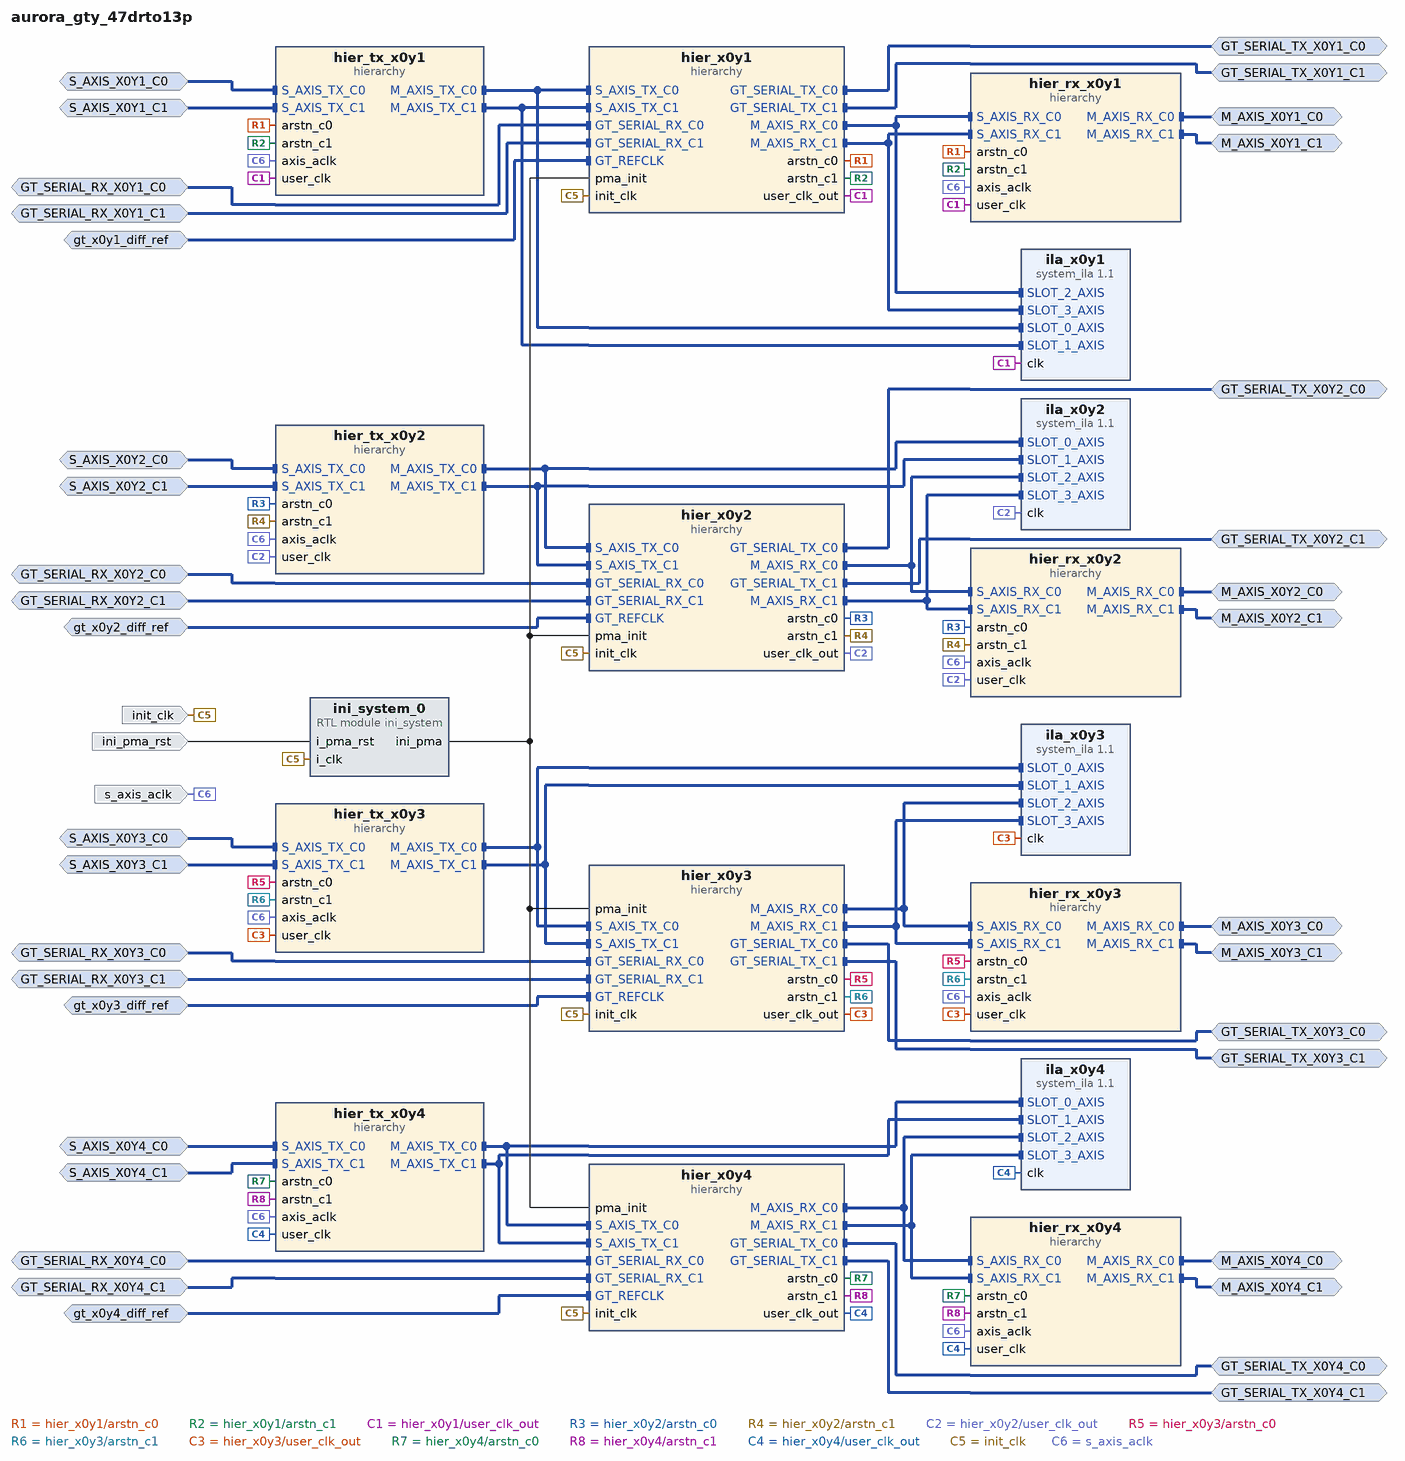
[diagram p0: block diagram of the top level]
# Vivado block design aurora_gty_47drto13p, xczu47dr-ffvg1517-2-i, Vivado 2025.2
create_bd_design aurora_gty_47drto13p

create_bd_intf_port -mode Slave -vlnv xilinx.com:interface:diff_clock_rtl:1.0 gt_x0y1_diff_ref
set_property -dict {CONFIG.FREQ_HZ 156250000} [get_bd_intf_ports gt_x0y1_diff_ref]
create_bd_intf_port -mode Slave -vlnv xilinx.com:interface:diff_clock_rtl:1.0 gt_x0y2_diff_ref
set_property -dict {CONFIG.FREQ_HZ 156250000} [get_bd_intf_ports gt_x0y2_diff_ref]
create_bd_intf_port -mode Slave -vlnv xilinx.com:display_aurora64b66b:GT_Serial_Transceiver_Pins_RX_rtl:1.0 GT_SERIAL_RX_X0Y1_C0
create_bd_intf_port -mode Slave -vlnv xilinx.com:display_aurora64b66b:GT_Serial_Transceiver_Pins_RX_rtl:1.0 GT_SERIAL_RX_X0Y1_C1
create_bd_intf_port -mode Master -vlnv xilinx.com:display_aurora64b66b:GT_Serial_Transceiver_Pins_TX_rtl:1.0 GT_SERIAL_TX_X0Y1_C1
create_bd_intf_port -mode Master -vlnv xilinx.com:display_aurora64b66b:GT_Serial_Transceiver_Pins_TX_rtl:1.0 GT_SERIAL_TX_X0Y2_C1
create_bd_intf_port -mode Slave -vlnv xilinx.com:display_aurora64b66b:GT_Serial_Transceiver_Pins_RX_rtl:1.0 GT_SERIAL_RX_X0Y2_C0
create_bd_intf_port -mode Slave -vlnv xilinx.com:display_aurora64b66b:GT_Serial_Transceiver_Pins_RX_rtl:1.0 GT_SERIAL_RX_X0Y2_C1
create_bd_intf_port -mode Master -vlnv xilinx.com:display_aurora64b66b:GT_Serial_Transceiver_Pins_TX_rtl:1.0 GT_SERIAL_TX_X0Y2_C0
create_bd_intf_port -mode Master -vlnv xilinx.com:display_aurora64b66b:GT_Serial_Transceiver_Pins_TX_rtl:1.0 GT_SERIAL_TX_X0Y1_C0
create_bd_intf_port -mode Master -vlnv xilinx.com:interface:axis_rtl:1.0 M_AXIS_X0Y2_C0
set_property -dict {CONFIG.FREQ_HZ 256000000} [get_bd_intf_ports M_AXIS_X0Y2_C0]
create_bd_intf_port -mode Master -vlnv xilinx.com:interface:axis_rtl:1.0 M_AXIS_X0Y2_C1
set_property -dict {CONFIG.FREQ_HZ 256000000} [get_bd_intf_ports M_AXIS_X0Y2_C1]
create_bd_intf_port -mode Master -vlnv xilinx.com:interface:axis_rtl:1.0 M_AXIS_X0Y1_C0
set_property -dict {CONFIG.FREQ_HZ 256000000} [get_bd_intf_ports M_AXIS_X0Y1_C0]
create_bd_intf_port -mode Master -vlnv xilinx.com:interface:axis_rtl:1.0 M_AXIS_X0Y1_C1
set_property -dict {CONFIG.FREQ_HZ 256000000} [get_bd_intf_ports M_AXIS_X0Y1_C1]
create_bd_intf_port -mode Slave -vlnv xilinx.com:interface:axis_rtl:1.0 S_AXIS_X0Y2_C1
set_property -dict [list \
  CONFIG.FREQ_HZ 256000000 \
  CONFIG.HAS_TKEEP 0 \
  CONFIG.HAS_TLAST 1 \
  CONFIG.HAS_TREADY 1 \
  CONFIG.HAS_TSTRB 0 \
  CONFIG.LAYERED_METADATA undef \
  CONFIG.TDATA_NUM_BYTES 20 \
  CONFIG.TDEST_WIDTH 0 \
  CONFIG.TID_WIDTH 0 \
  CONFIG.TUSER_WIDTH 64 \
] [get_bd_intf_ports S_AXIS_X0Y2_C1]
create_bd_intf_port -mode Slave -vlnv xilinx.com:interface:axis_rtl:1.0 S_AXIS_X0Y2_C0
set_property -dict [list \
  CONFIG.FREQ_HZ 256000000 \
  CONFIG.HAS_TKEEP 0 \
  CONFIG.HAS_TLAST 1 \
  CONFIG.HAS_TREADY 1 \
  CONFIG.HAS_TSTRB 0 \
  CONFIG.LAYERED_METADATA undef \
  CONFIG.TDATA_NUM_BYTES 20 \
  CONFIG.TDEST_WIDTH 0 \
  CONFIG.TID_WIDTH 0 \
  CONFIG.TUSER_WIDTH 64 \
] [get_bd_intf_ports S_AXIS_X0Y2_C0]
create_bd_intf_port -mode Slave -vlnv xilinx.com:interface:axis_rtl:1.0 S_AXIS_X0Y1_C1
set_property -dict [list \
  CONFIG.FREQ_HZ 256000000 \
  CONFIG.HAS_TKEEP 0 \
  CONFIG.HAS_TLAST 1 \
  CONFIG.HAS_TREADY 1 \
  CONFIG.HAS_TSTRB 0 \
  CONFIG.LAYERED_METADATA undef \
  CONFIG.TDATA_NUM_BYTES 20 \
  CONFIG.TDEST_WIDTH 0 \
  CONFIG.TID_WIDTH 0 \
  CONFIG.TUSER_WIDTH 64 \
] [get_bd_intf_ports S_AXIS_X0Y1_C1]
create_bd_intf_port -mode Slave -vlnv xilinx.com:interface:axis_rtl:1.0 S_AXIS_X0Y1_C0
set_property -dict [list \
  CONFIG.FREQ_HZ 256000000 \
  CONFIG.HAS_TKEEP 0 \
  CONFIG.HAS_TLAST 1 \
  CONFIG.HAS_TREADY 1 \
  CONFIG.HAS_TSTRB 0 \
  CONFIG.LAYERED_METADATA undef \
  CONFIG.TDATA_NUM_BYTES 20 \
  CONFIG.TDEST_WIDTH 0 \
  CONFIG.TID_WIDTH 0 \
  CONFIG.TUSER_WIDTH 64 \
] [get_bd_intf_ports S_AXIS_X0Y1_C0]
create_bd_intf_port -mode Slave -vlnv xilinx.com:interface:diff_clock_rtl:1.0 gt_x0y3_diff_ref
set_property -dict {CONFIG.FREQ_HZ 156250000} [get_bd_intf_ports gt_x0y3_diff_ref]
create_bd_intf_port -mode Slave -vlnv xilinx.com:display_aurora64b66b:GT_Serial_Transceiver_Pins_RX_rtl:1.0 GT_SERIAL_RX_X0Y3_C0
create_bd_intf_port -mode Slave -vlnv xilinx.com:display_aurora64b66b:GT_Serial_Transceiver_Pins_RX_rtl:1.0 GT_SERIAL_RX_X0Y3_C1
create_bd_intf_port -mode Master -vlnv xilinx.com:display_aurora64b66b:GT_Serial_Transceiver_Pins_TX_rtl:1.0 GT_SERIAL_TX_X0Y3_C1
create_bd_intf_port -mode Master -vlnv xilinx.com:display_aurora64b66b:GT_Serial_Transceiver_Pins_TX_rtl:1.0 GT_SERIAL_TX_X0Y3_C0
create_bd_intf_port -mode Master -vlnv xilinx.com:interface:axis_rtl:1.0 M_AXIS_X0Y3_C0
set_property -dict {CONFIG.FREQ_HZ 256000000} [get_bd_intf_ports M_AXIS_X0Y3_C0]
create_bd_intf_port -mode Master -vlnv xilinx.com:interface:axis_rtl:1.0 M_AXIS_X0Y3_C1
set_property -dict {CONFIG.FREQ_HZ 256000000} [get_bd_intf_ports M_AXIS_X0Y3_C1]
create_bd_intf_port -mode Slave -vlnv xilinx.com:interface:diff_clock_rtl:1.0 gt_x0y4_diff_ref
set_property -dict {CONFIG.FREQ_HZ 156250000} [get_bd_intf_ports gt_x0y4_diff_ref]
create_bd_intf_port -mode Slave -vlnv xilinx.com:display_aurora64b66b:GT_Serial_Transceiver_Pins_RX_rtl:1.0 GT_SERIAL_RX_X0Y4_C0
create_bd_intf_port -mode Slave -vlnv xilinx.com:display_aurora64b66b:GT_Serial_Transceiver_Pins_RX_rtl:1.0 GT_SERIAL_RX_X0Y4_C1
create_bd_intf_port -mode Master -vlnv xilinx.com:display_aurora64b66b:GT_Serial_Transceiver_Pins_TX_rtl:1.0 GT_SERIAL_TX_X0Y4_C1
create_bd_intf_port -mode Master -vlnv xilinx.com:display_aurora64b66b:GT_Serial_Transceiver_Pins_TX_rtl:1.0 GT_SERIAL_TX_X0Y4_C0
create_bd_intf_port -mode Master -vlnv xilinx.com:interface:axis_rtl:1.0 M_AXIS_X0Y4_C0
set_property -dict {CONFIG.FREQ_HZ 256000000} [get_bd_intf_ports M_AXIS_X0Y4_C0]
create_bd_intf_port -mode Master -vlnv xilinx.com:interface:axis_rtl:1.0 M_AXIS_X0Y4_C1
set_property -dict {CONFIG.FREQ_HZ 256000000} [get_bd_intf_ports M_AXIS_X0Y4_C1]
create_bd_intf_port -mode Slave -vlnv xilinx.com:interface:axis_rtl:1.0 S_AXIS_X0Y3_C1
set_property -dict [list \
  CONFIG.FREQ_HZ 256000000 \
  CONFIG.HAS_TKEEP 0 \
  CONFIG.HAS_TLAST 1 \
  CONFIG.HAS_TREADY 1 \
  CONFIG.HAS_TSTRB 0 \
  CONFIG.LAYERED_METADATA undef \
  CONFIG.TDATA_NUM_BYTES 20 \
  CONFIG.TDEST_WIDTH 0 \
  CONFIG.TID_WIDTH 0 \
  CONFIG.TUSER_WIDTH 64 \
] [get_bd_intf_ports S_AXIS_X0Y3_C1]
create_bd_intf_port -mode Slave -vlnv xilinx.com:interface:axis_rtl:1.0 S_AXIS_X0Y3_C0
set_property -dict [list \
  CONFIG.FREQ_HZ 256000000 \
  CONFIG.HAS_TKEEP 0 \
  CONFIG.HAS_TLAST 1 \
  CONFIG.HAS_TREADY 1 \
  CONFIG.HAS_TSTRB 0 \
  CONFIG.LAYERED_METADATA undef \
  CONFIG.TDATA_NUM_BYTES 20 \
  CONFIG.TDEST_WIDTH 0 \
  CONFIG.TID_WIDTH 0 \
  CONFIG.TUSER_WIDTH 64 \
] [get_bd_intf_ports S_AXIS_X0Y3_C0]
create_bd_intf_port -mode Slave -vlnv xilinx.com:interface:axis_rtl:1.0 S_AXIS_X0Y4_C1
set_property -dict [list \
  CONFIG.FREQ_HZ 256000000 \
  CONFIG.HAS_TKEEP 0 \
  CONFIG.HAS_TLAST 1 \
  CONFIG.HAS_TREADY 1 \
  CONFIG.HAS_TSTRB 0 \
  CONFIG.LAYERED_METADATA undef \
  CONFIG.TDATA_NUM_BYTES 20 \
  CONFIG.TDEST_WIDTH 0 \
  CONFIG.TID_WIDTH 0 \
  CONFIG.TUSER_WIDTH 64 \
] [get_bd_intf_ports S_AXIS_X0Y4_C1]
create_bd_intf_port -mode Slave -vlnv xilinx.com:interface:axis_rtl:1.0 S_AXIS_X0Y4_C0
set_property -dict [list \
  CONFIG.FREQ_HZ 256000000 \
  CONFIG.HAS_TKEEP 0 \
  CONFIG.HAS_TLAST 1 \
  CONFIG.HAS_TREADY 1 \
  CONFIG.HAS_TSTRB 0 \
  CONFIG.LAYERED_METADATA undef \
  CONFIG.TDATA_NUM_BYTES 20 \
  CONFIG.TDEST_WIDTH 0 \
  CONFIG.TID_WIDTH 0 \
  CONFIG.TUSER_WIDTH 64 \
] [get_bd_intf_ports S_AXIS_X0Y4_C0]
create_bd_port -dir I -type clk init_clk
create_bd_port -dir I -type rst ini_pma_rst
set_property -dict {CONFIG.POLARITY ACTIVE_HIGH} [get_bd_ports ini_pma_rst]
create_bd_port -dir I -type clk s_axis_aclk
set_property -dict [list \
  CONFIG.ASSOCIATED_BUSIF M_AXIS_X0Y2_C0:M_AXIS_X0Y2_C0_1:M_AXIS_X0Y1_C0:M_AXIS_X0Y1_C0_1:S_AXIS_X0Y2_C1:S_AXIS_X0Y2_C1_1:S_AXIS_X0Y1_C1:S_AXIS_X0Y1_C1_1:M_AXIS_X0Y3_C0:M_AXIS_X0Y3_C0_1:M_AXIS_X0Y4_C0:M_AXIS_X0Y4_C0_1:S_AXIS_X0Y3_C1:S_AXIS_X0Y3_C1_1:S_AXIS_X0Y4_C1:S_AXIS_X0Y4_C1_1:M_AXIS_X0Y2_C1:M_AXIS_X0Y1_C1:S_AXIS_X0Y2_C0:S_AXIS_X0Y1_C0:M_AXIS_X0Y3_C1:M_AXIS_X0Y4_C1:S_AXIS_X0Y3_C0:S_AXIS_X0Y4_C0 \
  CONFIG.FREQ_HZ 256000000 \
] [get_bd_ports s_axis_aclk]

create_bd_cell -type hier hier_x0y1
create_bd_cell -type hier hier_tx_x0y1
create_bd_cell -type hier hier_tx_x0y2
create_bd_cell -type hier hier_rx_x0y1
create_bd_cell -type module -reference ini_system ini_system_0
create_bd_cell -type hier hier_x0y2
create_bd_cell -type hier hier_rx_x0y2
create_bd_cell -type hier hier_x0y3
create_bd_cell -type hier hier_rx_x0y3
create_bd_cell -type hier hier_x0y4
create_bd_cell -type hier hier_rx_x0y4
create_bd_cell -type hier hier_tx_x0y3
create_bd_cell -type hier hier_tx_x0y4
create_bd_cell -type ip -vlnv xilinx.com:ip:system_ila:1.1 ila_x0y1
set_property -dict [list \
  CONFIG.C_DATA_DEPTH 2048 \
  CONFIG.C_MON_TYPE INTERFACE \
  CONFIG.C_NUM_MONITOR_SLOTS 4 \
  CONFIG.C_SLOT_0_INTF_TYPE xilinx.com:interface:axis_rtl:1.0 \
  CONFIG.C_SLOT_1_INTF_TYPE xilinx.com:interface:axis_rtl:1.0 \
  CONFIG.C_SLOT_2_INTF_TYPE xilinx.com:interface:axis_rtl:1.0 \
  CONFIG.C_SLOT_3_INTF_TYPE xilinx.com:interface:axis_rtl:1.0 \
] [get_bd_cells ila_x0y1]
create_bd_cell -type ip -vlnv xilinx.com:ip:system_ila:1.1 ila_x0y2
set_property -dict [list \
  CONFIG.C_DATA_DEPTH 2048 \
  CONFIG.C_MON_TYPE INTERFACE \
  CONFIG.C_NUM_MONITOR_SLOTS 4 \
  CONFIG.C_SLOT_0_INTF_TYPE xilinx.com:interface:axis_rtl:1.0 \
  CONFIG.C_SLOT_1_INTF_TYPE xilinx.com:interface:axis_rtl:1.0 \
  CONFIG.C_SLOT_2_INTF_TYPE xilinx.com:interface:axis_rtl:1.0 \
  CONFIG.C_SLOT_3_INTF_TYPE xilinx.com:interface:axis_rtl:1.0 \
] [get_bd_cells ila_x0y2]
create_bd_cell -type ip -vlnv xilinx.com:ip:system_ila:1.1 ila_x0y3
set_property -dict [list \
  CONFIG.C_DATA_DEPTH 2048 \
  CONFIG.C_MON_TYPE INTERFACE \
  CONFIG.C_NUM_MONITOR_SLOTS 4 \
  CONFIG.C_SLOT_0_INTF_TYPE xilinx.com:interface:axis_rtl:1.0 \
  CONFIG.C_SLOT_1_INTF_TYPE xilinx.com:interface:axis_rtl:1.0 \
  CONFIG.C_SLOT_2_INTF_TYPE xilinx.com:interface:axis_rtl:1.0 \
  CONFIG.C_SLOT_3_INTF_TYPE xilinx.com:interface:axis_rtl:1.0 \
] [get_bd_cells ila_x0y3]
create_bd_cell -type ip -vlnv xilinx.com:ip:system_ila:1.1 ila_x0y4
set_property -dict [list \
  CONFIG.C_DATA_DEPTH 2048 \
  CONFIG.C_MON_TYPE INTERFACE \
  CONFIG.C_NUM_MONITOR_SLOTS 4 \
  CONFIG.C_SLOT_0_INTF_TYPE xilinx.com:interface:axis_rtl:1.0 \
  CONFIG.C_SLOT_1_INTF_TYPE xilinx.com:interface:axis_rtl:1.0 \
  CONFIG.C_SLOT_2_INTF_TYPE xilinx.com:interface:axis_rtl:1.0 \
  CONFIG.C_SLOT_3_INTF_TYPE xilinx.com:interface:axis_rtl:1.0 \
] [get_bd_cells ila_x0y4]

# ---- hierarchy /hier_x0y1 ----
current_bd_instance /hier_x0y1
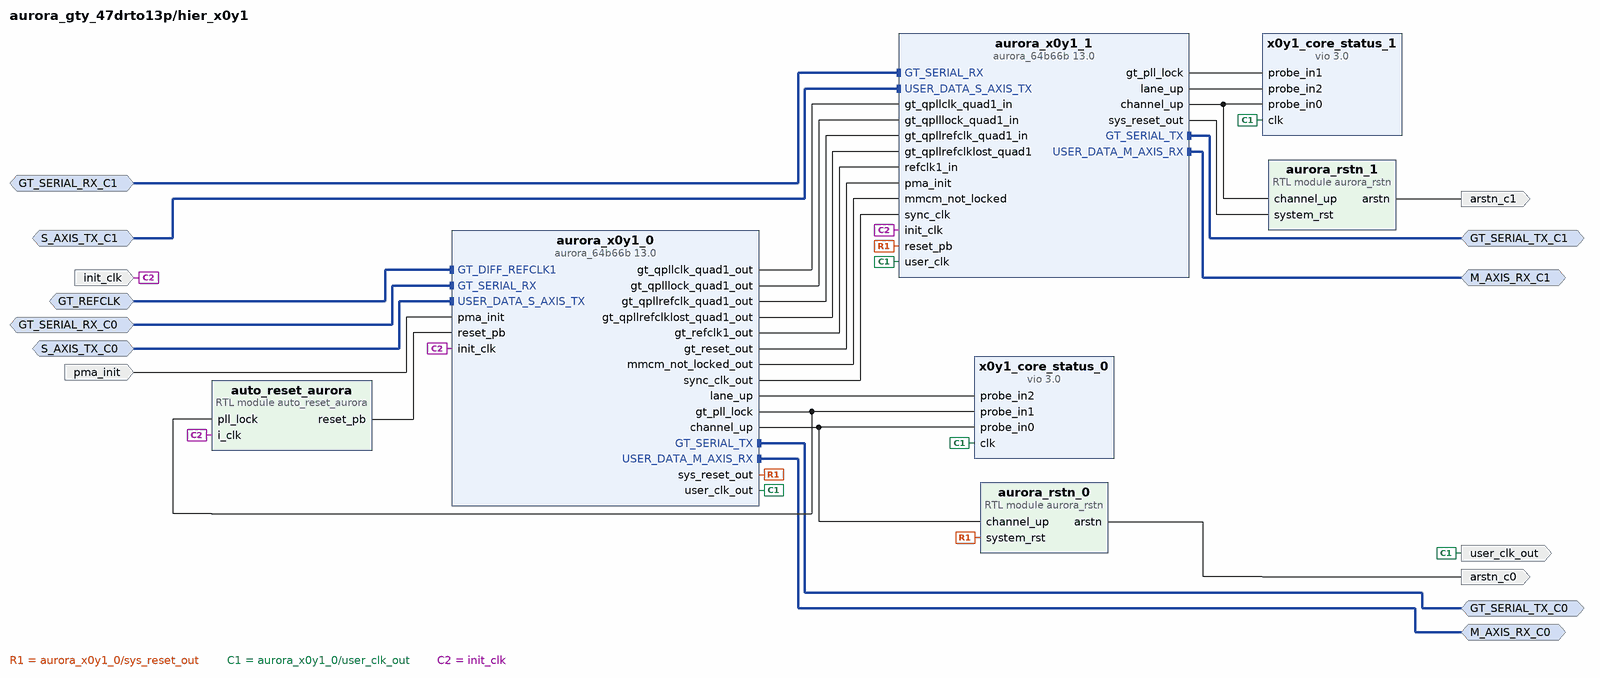
[diagram p1: block diagram inside /hier_x0y1]
create_bd_intf_pin -mode Slave -vlnv xilinx.com:interface:axis_rtl:1.0 S_AXIS_TX_C1
create_bd_intf_pin -mode Master -vlnv xilinx.com:interface:axis_rtl:1.0 M_AXIS_RX_C0
create_bd_intf_pin -mode Slave -vlnv xilinx.com:interface:axis_rtl:1.0 S_AXIS_TX_C0
create_bd_intf_pin -mode Master -vlnv xilinx.com:interface:axis_rtl:1.0 M_AXIS_RX_C1
create_bd_intf_pin -mode Slave -vlnv xilinx.com:interface:diff_clock_rtl:1.0 GT_REFCLK
create_bd_intf_pin -mode Slave -vlnv xilinx.com:display_aurora64b66b:GT_Serial_Transceiver_Pins_RX_rtl:1.0 GT_SERIAL_RX_C0
create_bd_intf_pin -mode Slave -vlnv xilinx.com:display_aurora64b66b:GT_Serial_Transceiver_Pins_RX_rtl:1.0 GT_SERIAL_RX_C1
create_bd_intf_pin -mode Master -vlnv xilinx.com:display_aurora64b66b:GT_Serial_Transceiver_Pins_TX_rtl:1.0 GT_SERIAL_TX_C1
create_bd_intf_pin -mode Master -vlnv xilinx.com:display_aurora64b66b:GT_Serial_Transceiver_Pins_TX_rtl:1.0 GT_SERIAL_TX_C0
create_bd_pin -dir O -type clk user_clk_out
create_bd_pin -dir I -type clk init_clk
create_bd_pin -dir I -type rst pma_init
create_bd_pin -dir O arstn_c0
create_bd_pin -dir O arstn_c1

create_bd_cell -type ip -vlnv xilinx.com:ip:vio:3.0 x0y1_core_status_0
set_property -dict [list \
  CONFIG.C_NUM_PROBE_IN 3 \
  CONFIG.C_NUM_PROBE_OUT 0 \
  CONFIG.C_PROBE_IN2_WIDTH 2 \
  CONFIG.C_PROBE_IN5_WIDTH 2 \
] [get_bd_cells x0y1_core_status_0]
create_bd_cell -type ip -vlnv xilinx.com:ip:vio:3.0 x0y1_core_status_1
set_property -dict {CONFIG.C_NUM_PROBE_IN 3 CONFIG.C_NUM_PROBE_OUT 0 CONFIG.C_PROBE_IN2_WIDTH 2} [get_bd_cells x0y1_core_status_1]
create_bd_cell -type module -reference auto_reset_aurora auto_reset_aurora
create_bd_cell -type ip -vlnv xilinx.com:ip:aurora_64b66b:13.0 aurora_x0y1_0
set_property -dict [list \
  CONFIG.CHANNEL_ENABLE {X0Y4 X0Y5} \
  CONFIG.C_AURORA_LANES 2 \
  CONFIG.C_LINE_RATE 25.625 \
  CONFIG.C_START_QUAD Quad_X0Y1 \
  CONFIG.SupportLevel 1 \
  CONFIG.drp_mode Disabled \
] [get_bd_cells aurora_x0y1_0]
create_bd_cell -type ip -vlnv xilinx.com:ip:aurora_64b66b:13.0 aurora_x0y1_1
set_property -dict [list \
  CONFIG.CHANNEL_ENABLE {X0Y6 X0Y7} \
  CONFIG.C_AURORA_LANES 2 \
  CONFIG.C_LINE_RATE 25.625 \
  CONFIG.C_START_LANE X0Y6 \
  CONFIG.C_START_QUAD Quad_X0Y1 \
  CONFIG.drp_mode Disabled \
] [get_bd_cells aurora_x0y1_1]
create_bd_cell -type module -reference aurora_rstn aurora_rstn_0
create_bd_cell -type module -reference aurora_rstn aurora_rstn_1

# ---- hierarchy /hier_tx_x0y1 ----
current_bd_instance /hier_tx_x0y1
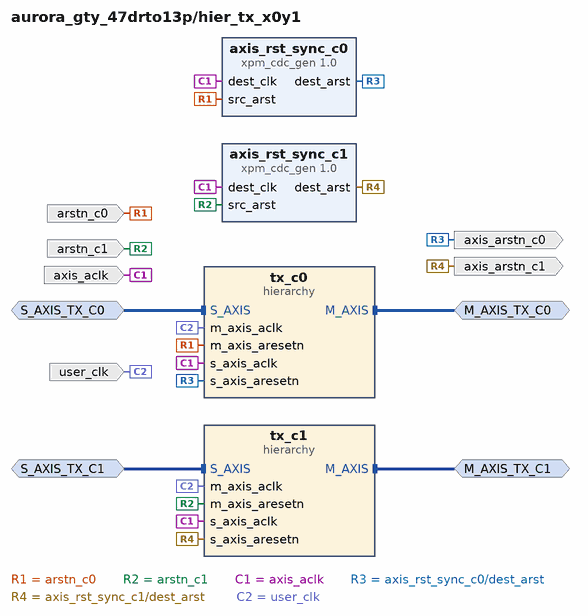
[diagram p2: block diagram inside /hier_tx_x0y1]
create_bd_intf_pin -mode Master -vlnv xilinx.com:interface:axis_rtl:1.0 M_AXIS_TX_C0
create_bd_intf_pin -mode Master -vlnv xilinx.com:interface:axis_rtl:1.0 M_AXIS_TX_C1
create_bd_intf_pin -mode Slave -vlnv xilinx.com:interface:axis_rtl:1.0 S_AXIS_TX_C1
create_bd_intf_pin -mode Slave -vlnv xilinx.com:interface:axis_rtl:1.0 S_AXIS_TX_C0
create_bd_pin -dir I -type clk user_clk
create_bd_pin -dir I arstn_c1
create_bd_pin -dir I -type clk axis_aclk
create_bd_pin -dir O axis_arstn_c0
create_bd_pin -dir O axis_arstn_c1
create_bd_pin -dir I arstn_c0

create_bd_cell -type ip -vlnv xilinx.com:ip:xpm_cdc_gen:1.0 axis_rst_sync_c0
set_property -dict {CONFIG.CDC_TYPE xpm_cdc_async_rst} [get_bd_cells axis_rst_sync_c0]
create_bd_cell -type ip -vlnv xilinx.com:ip:xpm_cdc_gen:1.0 axis_rst_sync_c1
set_property -dict {CONFIG.CDC_TYPE xpm_cdc_async_rst} [get_bd_cells axis_rst_sync_c1]
create_bd_cell -type hier tx_c0
create_bd_cell -type hier tx_c1

# ---- hierarchy /hier_tx_x0y1/tx_c0 ----
current_bd_instance /hier_tx_x0y1/tx_c0
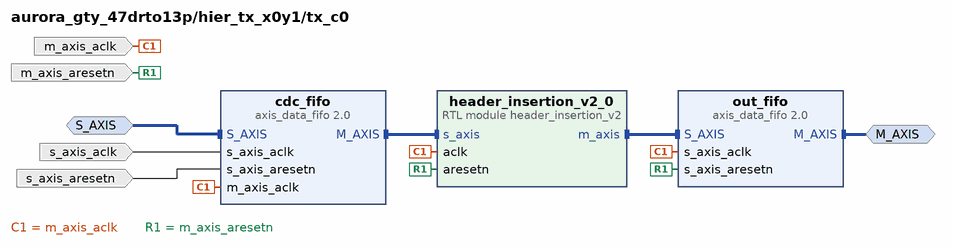
[diagram p3: block diagram inside /hier_tx_x0y1/tx_c0]
create_bd_intf_pin -mode Slave -vlnv xilinx.com:interface:axis_rtl:1.0 S_AXIS
create_bd_intf_pin -mode Master -vlnv xilinx.com:interface:axis_rtl:1.0 M_AXIS
create_bd_pin -dir I -type clk m_axis_aclk
create_bd_pin -dir I -type rst m_axis_aresetn
create_bd_pin -dir I s_axis_aresetn
create_bd_pin -dir I -type clk s_axis_aclk

create_bd_cell -type module -reference header_insertion_v2 header_insertion_v2_0
create_bd_cell -type ip -vlnv xilinx.com:ip:axis_data_fifo:2.0 cdc_fifo
set_property -dict [list \
  CONFIG.FIFO_DEPTH 16 \
  CONFIG.HAS_TLAST 1 \
  CONFIG.IS_ACLK_ASYNC 1 \
  CONFIG.TDATA_NUM_BYTES 20 \
  CONFIG.TUSER_WIDTH 64 \
] [get_bd_cells cdc_fifo]
create_bd_cell -type ip -vlnv xilinx.com:ip:axis_data_fifo:2.0 out_fifo
set_property -dict {CONFIG.FIFO_DEPTH 16 CONFIG.HAS_TLAST 1 CONFIG.TDATA_NUM_BYTES 16} [get_bd_cells out_fifo]

# ---- hierarchy /hier_tx_x0y1/tx_c1 ----
current_bd_instance /hier_tx_x0y1/tx_c1
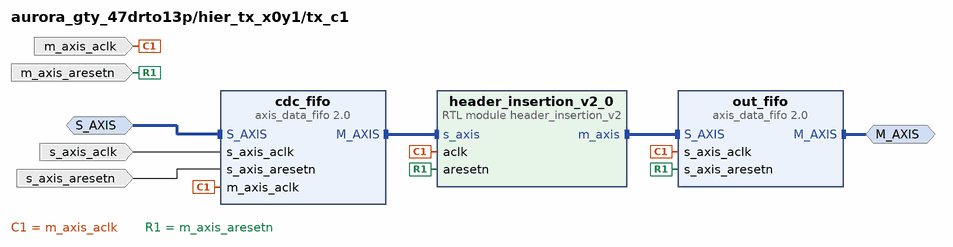
[diagram p4: block diagram inside /hier_tx_x0y1/tx_c1]
create_bd_intf_pin -mode Slave -vlnv xilinx.com:interface:axis_rtl:1.0 S_AXIS
create_bd_intf_pin -mode Master -vlnv xilinx.com:interface:axis_rtl:1.0 M_AXIS
create_bd_pin -dir I -type clk m_axis_aclk
create_bd_pin -dir I -type rst m_axis_aresetn
create_bd_pin -dir I s_axis_aresetn
create_bd_pin -dir I -type clk s_axis_aclk

create_bd_cell -type module -reference header_insertion_v2 header_insertion_v2_0
create_bd_cell -type ip -vlnv xilinx.com:ip:axis_data_fifo:2.0 cdc_fifo
set_property -dict [list \
  CONFIG.FIFO_DEPTH 16 \
  CONFIG.HAS_TLAST 1 \
  CONFIG.IS_ACLK_ASYNC 1 \
  CONFIG.TDATA_NUM_BYTES 20 \
  CONFIG.TUSER_WIDTH 64 \
] [get_bd_cells cdc_fifo]
create_bd_cell -type ip -vlnv xilinx.com:ip:axis_data_fifo:2.0 out_fifo
set_property -dict {CONFIG.FIFO_DEPTH 16 CONFIG.HAS_TLAST 1 CONFIG.TDATA_NUM_BYTES 16} [get_bd_cells out_fifo]

# ---- hierarchy /hier_tx_x0y2 ----
current_bd_instance /hier_tx_x0y2
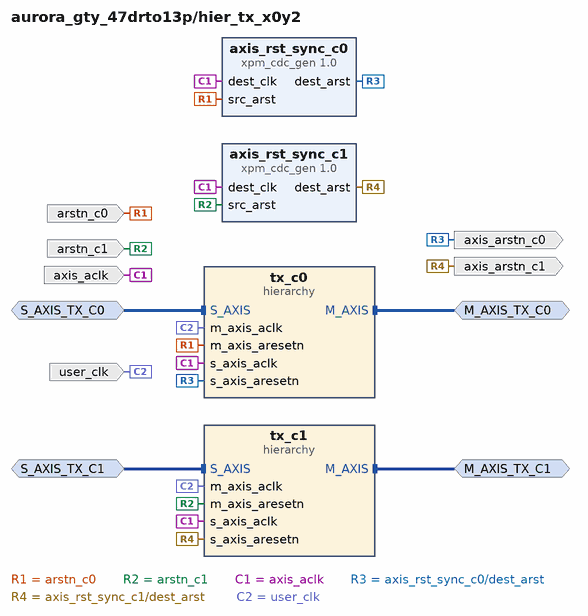
[diagram p5: block diagram inside /hier_tx_x0y2]
create_bd_intf_pin -mode Master -vlnv xilinx.com:interface:axis_rtl:1.0 M_AXIS_TX_C0
create_bd_intf_pin -mode Master -vlnv xilinx.com:interface:axis_rtl:1.0 M_AXIS_TX_C1
create_bd_intf_pin -mode Slave -vlnv xilinx.com:interface:axis_rtl:1.0 S_AXIS_TX_C1
create_bd_intf_pin -mode Slave -vlnv xilinx.com:interface:axis_rtl:1.0 S_AXIS_TX_C0
create_bd_pin -dir I -type clk user_clk
create_bd_pin -dir I -type clk axis_aclk
create_bd_pin -dir O -type rst axis_arstn_c0
create_bd_pin -dir O -type rst axis_arstn_c1
create_bd_pin -dir I -type rst arstn_c1
create_bd_pin -dir I -type rst arstn_c0

create_bd_cell -type ip -vlnv xilinx.com:ip:xpm_cdc_gen:1.0 axis_rst_sync_c0
set_property -dict {CONFIG.CDC_TYPE xpm_cdc_async_rst} [get_bd_cells axis_rst_sync_c0]
create_bd_cell -type ip -vlnv xilinx.com:ip:xpm_cdc_gen:1.0 axis_rst_sync_c1
set_property -dict {CONFIG.CDC_TYPE xpm_cdc_async_rst} [get_bd_cells axis_rst_sync_c1]
create_bd_cell -type hier tx_c0
create_bd_cell -type hier tx_c1

# ---- hierarchy /hier_tx_x0y2/tx_c0 ----
current_bd_instance /hier_tx_x0y2/tx_c0
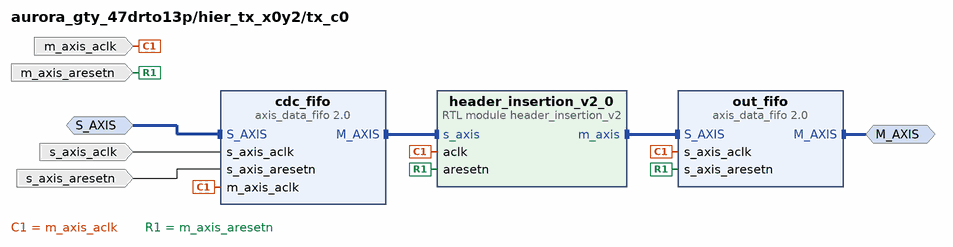
[diagram p6: block diagram inside /hier_tx_x0y2/tx_c0]
create_bd_intf_pin -mode Slave -vlnv xilinx.com:interface:axis_rtl:1.0 S_AXIS
create_bd_intf_pin -mode Master -vlnv xilinx.com:interface:axis_rtl:1.0 M_AXIS
create_bd_pin -dir I -type clk m_axis_aclk
create_bd_pin -dir I -type rst m_axis_aresetn
create_bd_pin -dir I s_axis_aresetn
create_bd_pin -dir I -type clk s_axis_aclk

create_bd_cell -type module -reference header_insertion_v2 header_insertion_v2_0
create_bd_cell -type ip -vlnv xilinx.com:ip:axis_data_fifo:2.0 cdc_fifo
set_property -dict [list \
  CONFIG.FIFO_DEPTH 16 \
  CONFIG.HAS_TLAST 1 \
  CONFIG.IS_ACLK_ASYNC 1 \
  CONFIG.TDATA_NUM_BYTES 20 \
  CONFIG.TUSER_WIDTH 64 \
] [get_bd_cells cdc_fifo]
create_bd_cell -type ip -vlnv xilinx.com:ip:axis_data_fifo:2.0 out_fifo
set_property -dict {CONFIG.FIFO_DEPTH 16 CONFIG.HAS_TLAST 1 CONFIG.TDATA_NUM_BYTES 16} [get_bd_cells out_fifo]

# ---- hierarchy /hier_tx_x0y2/tx_c1 ----
current_bd_instance /hier_tx_x0y2/tx_c1
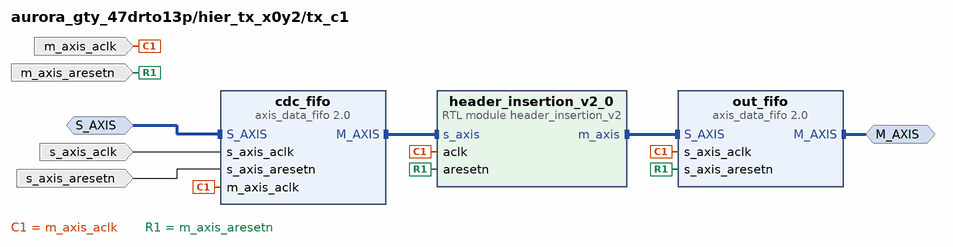
[diagram p7: block diagram inside /hier_tx_x0y2/tx_c1]
create_bd_intf_pin -mode Slave -vlnv xilinx.com:interface:axis_rtl:1.0 S_AXIS
create_bd_intf_pin -mode Master -vlnv xilinx.com:interface:axis_rtl:1.0 M_AXIS
create_bd_pin -dir I -type clk m_axis_aclk
create_bd_pin -dir I -type rst m_axis_aresetn
create_bd_pin -dir I s_axis_aresetn
create_bd_pin -dir I -type clk s_axis_aclk

create_bd_cell -type module -reference header_insertion_v2 header_insertion_v2_0
create_bd_cell -type ip -vlnv xilinx.com:ip:axis_data_fifo:2.0 cdc_fifo
set_property -dict [list \
  CONFIG.FIFO_DEPTH 16 \
  CONFIG.HAS_TLAST 1 \
  CONFIG.IS_ACLK_ASYNC 1 \
  CONFIG.TDATA_NUM_BYTES 20 \
  CONFIG.TUSER_WIDTH 64 \
] [get_bd_cells cdc_fifo]
create_bd_cell -type ip -vlnv xilinx.com:ip:axis_data_fifo:2.0 out_fifo
set_property -dict {CONFIG.FIFO_DEPTH 16 CONFIG.HAS_TLAST 1 CONFIG.TDATA_NUM_BYTES 16} [get_bd_cells out_fifo]

# ---- hierarchy /hier_rx_x0y1 ----
current_bd_instance /hier_rx_x0y1
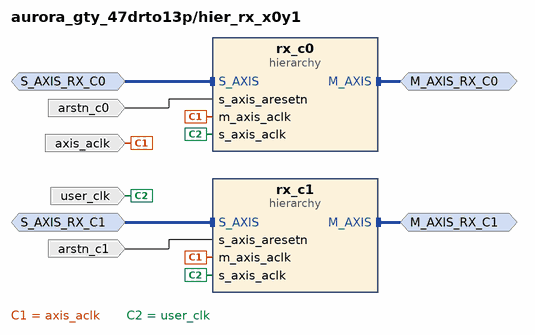
[diagram p8: block diagram inside /hier_rx_x0y1]
create_bd_intf_pin -mode Slave -vlnv xilinx.com:interface:axis_rtl:1.0 S_AXIS_RX_C0
create_bd_intf_pin -mode Slave -vlnv xilinx.com:interface:axis_rtl:1.0 S_AXIS_RX_C1
create_bd_intf_pin -mode Master -vlnv xilinx.com:interface:axis_rtl:1.0 M_AXIS_RX_C0
create_bd_intf_pin -mode Master -vlnv xilinx.com:interface:axis_rtl:1.0 M_AXIS_RX_C1
create_bd_pin -dir I -type clk user_clk
create_bd_pin -dir I -type clk axis_aclk
create_bd_pin -dir I -type rst arstn_c0
create_bd_pin -dir I -type rst arstn_c1

create_bd_cell -type hier rx_c0
create_bd_cell -type hier rx_c1

# ---- hierarchy /hier_rx_x0y1/rx_c0 ----
current_bd_instance /hier_rx_x0y1/rx_c0
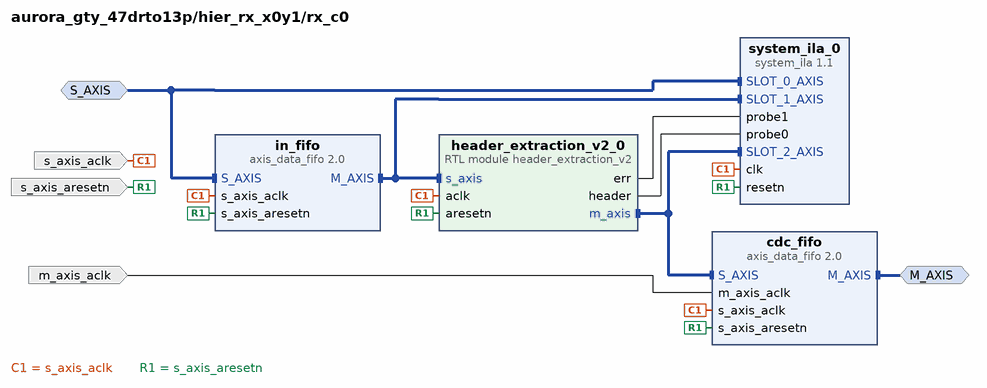
[diagram p9: block diagram inside /hier_rx_x0y1/rx_c0]
create_bd_intf_pin -mode Slave -vlnv xilinx.com:interface:axis_rtl:1.0 S_AXIS
create_bd_intf_pin -mode Master -vlnv xilinx.com:interface:axis_rtl:1.0 M_AXIS
create_bd_pin -dir I -type rst s_axis_aresetn
create_bd_pin -dir I -type clk s_axis_aclk
create_bd_pin -dir I -type clk m_axis_aclk

create_bd_cell -type ip -vlnv xilinx.com:ip:axis_data_fifo:2.0 in_fifo
create_bd_cell -type ip -vlnv xilinx.com:ip:axis_data_fifo:2.0 cdc_fifo
set_property -dict [list \
  CONFIG.FIFO_DEPTH 512 \
  CONFIG.HAS_TLAST 1 \
  CONFIG.IS_ACLK_ASYNC 1 \
  CONFIG.TDATA_NUM_BYTES 20 \
  CONFIG.TUSER_WIDTH 64 \
] [get_bd_cells cdc_fifo]
create_bd_cell -type module -reference header_extraction_v2 header_extraction_v2_0
create_bd_cell -type ip -vlnv xilinx.com:ip:system_ila:1.1 system_ila_0
set_property -dict [list \
  CONFIG.C_MON_TYPE MIX \
  CONFIG.C_NUM_MONITOR_SLOTS 3 \
  CONFIG.C_NUM_OF_PROBES 2 \
  CONFIG.C_SLOT 2 \
  CONFIG.C_SLOT_0_INTF_TYPE xilinx.com:interface:axis_rtl:1.0 \
  CONFIG.C_SLOT_1_INTF_TYPE xilinx.com:interface:axis_rtl:1.0 \
  CONFIG.C_SLOT_2_INTF_TYPE xilinx.com:interface:axis_rtl:1.0 \
] [get_bd_cells system_ila_0]

# ---- hierarchy /hier_rx_x0y1/rx_c1 ----
current_bd_instance /hier_rx_x0y1/rx_c1
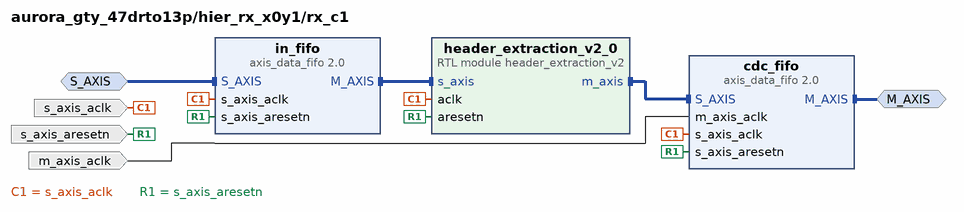
[diagram p10: block diagram inside /hier_rx_x0y1/rx_c1]
create_bd_intf_pin -mode Slave -vlnv xilinx.com:interface:axis_rtl:1.0 S_AXIS
create_bd_intf_pin -mode Master -vlnv xilinx.com:interface:axis_rtl:1.0 M_AXIS
create_bd_pin -dir I -type rst s_axis_aresetn
create_bd_pin -dir I -type clk s_axis_aclk
create_bd_pin -dir I -type clk m_axis_aclk

create_bd_cell -type ip -vlnv xilinx.com:ip:axis_data_fifo:2.0 in_fifo
create_bd_cell -type ip -vlnv xilinx.com:ip:axis_data_fifo:2.0 cdc_fifo
set_property -dict [list \
  CONFIG.FIFO_DEPTH 512 \
  CONFIG.HAS_TLAST 1 \
  CONFIG.IS_ACLK_ASYNC 1 \
  CONFIG.TDATA_NUM_BYTES 20 \
  CONFIG.TUSER_WIDTH 64 \
] [get_bd_cells cdc_fifo]
create_bd_cell -type module -reference header_extraction_v2 header_extraction_v2_0

# ---- hierarchy /hier_x0y2 ----
current_bd_instance /hier_x0y2
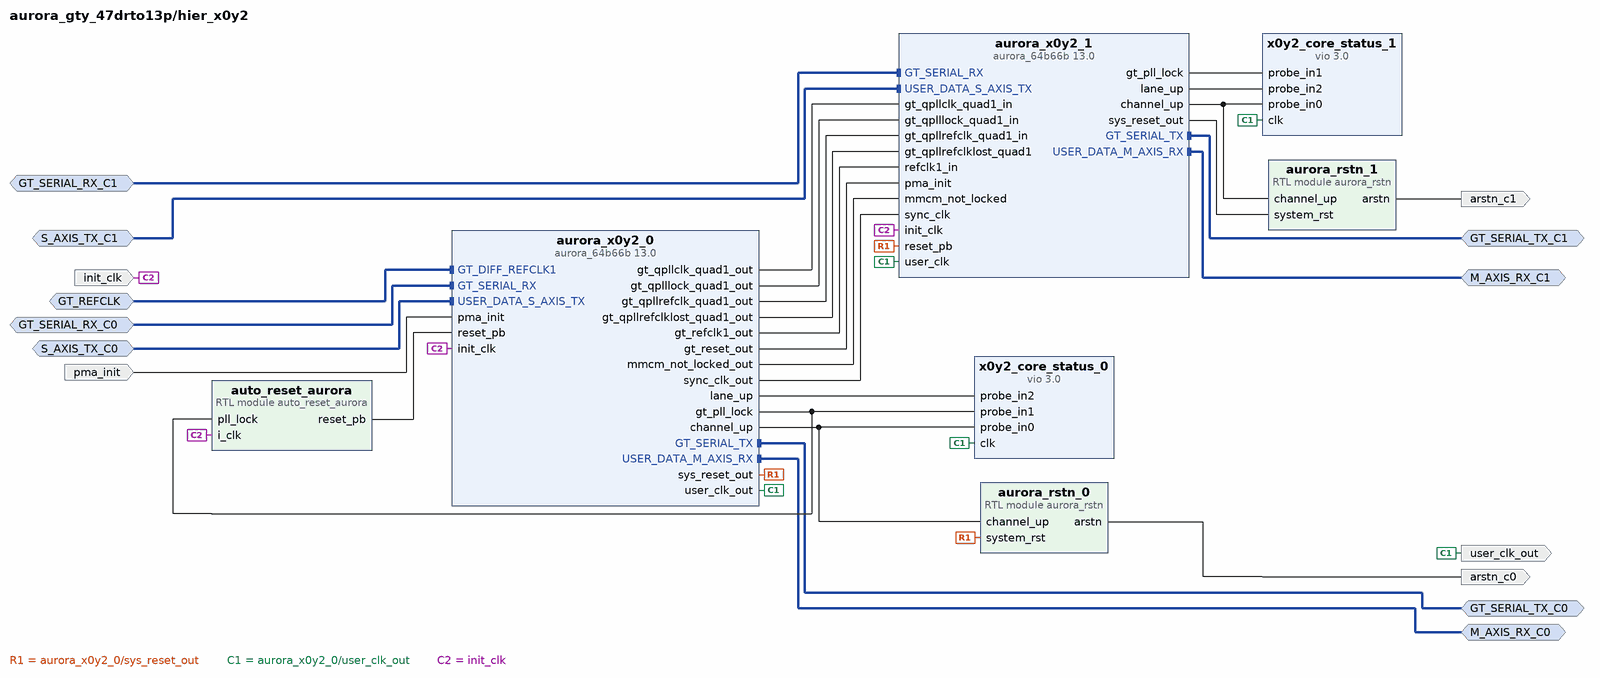
[diagram p11: block diagram inside /hier_x0y2]
create_bd_intf_pin -mode Slave -vlnv xilinx.com:interface:axis_rtl:1.0 S_AXIS_TX_C1
create_bd_intf_pin -mode Master -vlnv xilinx.com:interface:axis_rtl:1.0 M_AXIS_RX_C0
create_bd_intf_pin -mode Slave -vlnv xilinx.com:interface:axis_rtl:1.0 S_AXIS_TX_C0
create_bd_intf_pin -mode Master -vlnv xilinx.com:interface:axis_rtl:1.0 M_AXIS_RX_C1
create_bd_intf_pin -mode Slave -vlnv xilinx.com:interface:diff_clock_rtl:1.0 GT_REFCLK
create_bd_intf_pin -mode Slave -vlnv xilinx.com:display_aurora64b66b:GT_Serial_Transceiver_Pins_RX_rtl:1.0 GT_SERIAL_RX_C0
create_bd_intf_pin -mode Slave -vlnv xilinx.com:display_aurora64b66b:GT_Serial_Transceiver_Pins_RX_rtl:1.0 GT_SERIAL_RX_C1
create_bd_intf_pin -mode Master -vlnv xilinx.com:display_aurora64b66b:GT_Serial_Transceiver_Pins_TX_rtl:1.0 GT_SERIAL_TX_C1
create_bd_intf_pin -mode Master -vlnv xilinx.com:display_aurora64b66b:GT_Serial_Transceiver_Pins_TX_rtl:1.0 GT_SERIAL_TX_C0
create_bd_pin -dir O -type clk user_clk_out
create_bd_pin -dir I -type clk init_clk
create_bd_pin -dir I -type rst pma_init
create_bd_pin -dir O arstn_c0
create_bd_pin -dir O arstn_c1

create_bd_cell -type ip -vlnv xilinx.com:ip:vio:3.0 x0y2_core_status_0
set_property -dict [list \
  CONFIG.C_NUM_PROBE_IN 3 \
  CONFIG.C_NUM_PROBE_OUT 0 \
  CONFIG.C_PROBE_IN2_WIDTH 2 \
  CONFIG.C_PROBE_IN5_WIDTH 2 \
] [get_bd_cells x0y2_core_status_0]
create_bd_cell -type ip -vlnv xilinx.com:ip:vio:3.0 x0y2_core_status_1
set_property -dict {CONFIG.C_NUM_PROBE_IN 3 CONFIG.C_NUM_PROBE_OUT 0 CONFIG.C_PROBE_IN2_WIDTH 2} [get_bd_cells x0y2_core_status_1]
create_bd_cell -type module -reference auto_reset_aurora auto_reset_aurora
create_bd_cell -type ip -vlnv xilinx.com:ip:aurora_64b66b:13.0 aurora_x0y2_0
set_property -dict [list \
  CONFIG.CHANNEL_ENABLE {X0Y8 X0Y9} \
  CONFIG.C_AURORA_LANES 2 \
  CONFIG.C_LINE_RATE 25.625 \
  CONFIG.C_REFCLK_SOURCE MGTREFCLK0_of_Quad_X0Y2 \
  CONFIG.C_START_LANE X0Y8 \
  CONFIG.C_START_QUAD Quad_X0Y2 \
  CONFIG.SupportLevel 1 \
  CONFIG.drp_mode Disabled \
] [get_bd_cells aurora_x0y2_0]
create_bd_cell -type ip -vlnv xilinx.com:ip:aurora_64b66b:13.0 aurora_x0y2_1
set_property -dict [list \
  CONFIG.CHANNEL_ENABLE {X0Y10 X0Y11} \
  CONFIG.C_AURORA_LANES 2 \
  CONFIG.C_LINE_RATE 25.625 \
  CONFIG.C_REFCLK_SOURCE MGTREFCLK0_of_Quad_X0Y2 \
  CONFIG.C_START_LANE X0Y10 \
  CONFIG.C_START_QUAD Quad_X0Y2 \
  CONFIG.drp_mode Disabled \
] [get_bd_cells aurora_x0y2_1]
create_bd_cell -type module -reference aurora_rstn aurora_rstn_0
create_bd_cell -type module -reference aurora_rstn aurora_rstn_1

# ---- hierarchy /hier_rx_x0y2 ----
current_bd_instance /hier_rx_x0y2
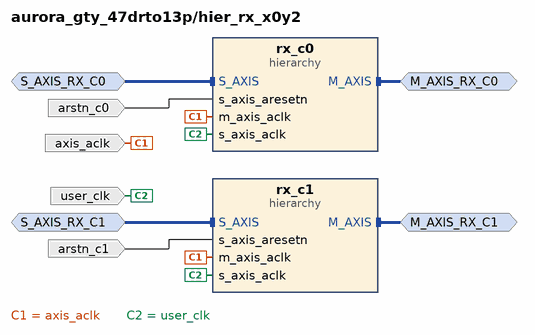
[diagram p12: block diagram inside /hier_rx_x0y2]
create_bd_intf_pin -mode Slave -vlnv xilinx.com:interface:axis_rtl:1.0 S_AXIS_RX_C0
create_bd_intf_pin -mode Slave -vlnv xilinx.com:interface:axis_rtl:1.0 S_AXIS_RX_C1
create_bd_intf_pin -mode Master -vlnv xilinx.com:interface:axis_rtl:1.0 M_AXIS_RX_C0
create_bd_intf_pin -mode Master -vlnv xilinx.com:interface:axis_rtl:1.0 M_AXIS_RX_C1
create_bd_pin -dir I -type clk user_clk
create_bd_pin -dir I -type clk axis_aclk
create_bd_pin -dir I -type rst arstn_c0
create_bd_pin -dir I -type rst arstn_c1

create_bd_cell -type hier rx_c0
create_bd_cell -type hier rx_c1

# ---- hierarchy /hier_rx_x0y2/rx_c0 ----
current_bd_instance /hier_rx_x0y2/rx_c0
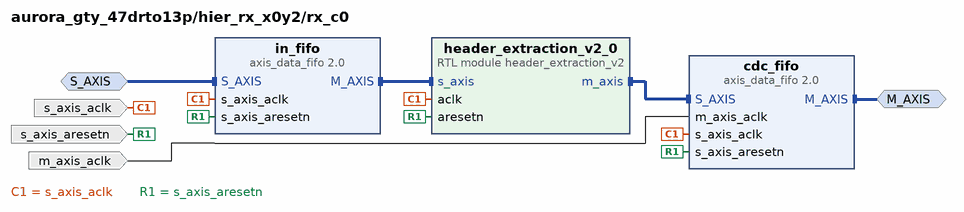
[diagram p13: block diagram inside /hier_rx_x0y2/rx_c0]
create_bd_intf_pin -mode Slave -vlnv xilinx.com:interface:axis_rtl:1.0 S_AXIS
create_bd_intf_pin -mode Master -vlnv xilinx.com:interface:axis_rtl:1.0 M_AXIS
create_bd_pin -dir I -type rst s_axis_aresetn
create_bd_pin -dir I -type clk s_axis_aclk
create_bd_pin -dir I -type clk m_axis_aclk

create_bd_cell -type ip -vlnv xilinx.com:ip:axis_data_fifo:2.0 in_fifo
create_bd_cell -type ip -vlnv xilinx.com:ip:axis_data_fifo:2.0 cdc_fifo
set_property -dict [list \
  CONFIG.FIFO_DEPTH 512 \
  CONFIG.HAS_TLAST 1 \
  CONFIG.IS_ACLK_ASYNC 1 \
  CONFIG.TDATA_NUM_BYTES 20 \
  CONFIG.TUSER_WIDTH 64 \
] [get_bd_cells cdc_fifo]
create_bd_cell -type module -reference header_extraction_v2 header_extraction_v2_0

# ---- hierarchy /hier_rx_x0y2/rx_c1 ----
current_bd_instance /hier_rx_x0y2/rx_c1
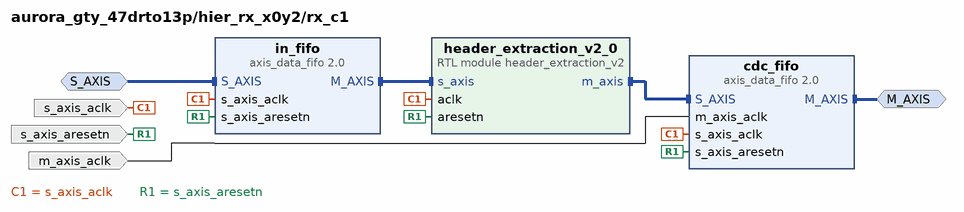
[diagram p14: block diagram inside /hier_rx_x0y2/rx_c1]
create_bd_intf_pin -mode Slave -vlnv xilinx.com:interface:axis_rtl:1.0 S_AXIS
create_bd_intf_pin -mode Master -vlnv xilinx.com:interface:axis_rtl:1.0 M_AXIS
create_bd_pin -dir I -type rst s_axis_aresetn
create_bd_pin -dir I -type clk s_axis_aclk
create_bd_pin -dir I -type clk m_axis_aclk

create_bd_cell -type ip -vlnv xilinx.com:ip:axis_data_fifo:2.0 in_fifo
create_bd_cell -type ip -vlnv xilinx.com:ip:axis_data_fifo:2.0 cdc_fifo
set_property -dict [list \
  CONFIG.FIFO_DEPTH 512 \
  CONFIG.HAS_TLAST 1 \
  CONFIG.IS_ACLK_ASYNC 1 \
  CONFIG.TDATA_NUM_BYTES 20 \
  CONFIG.TUSER_WIDTH 64 \
] [get_bd_cells cdc_fifo]
create_bd_cell -type module -reference header_extraction_v2 header_extraction_v2_0

# ---- hierarchy /hier_x0y3 ----
current_bd_instance /hier_x0y3
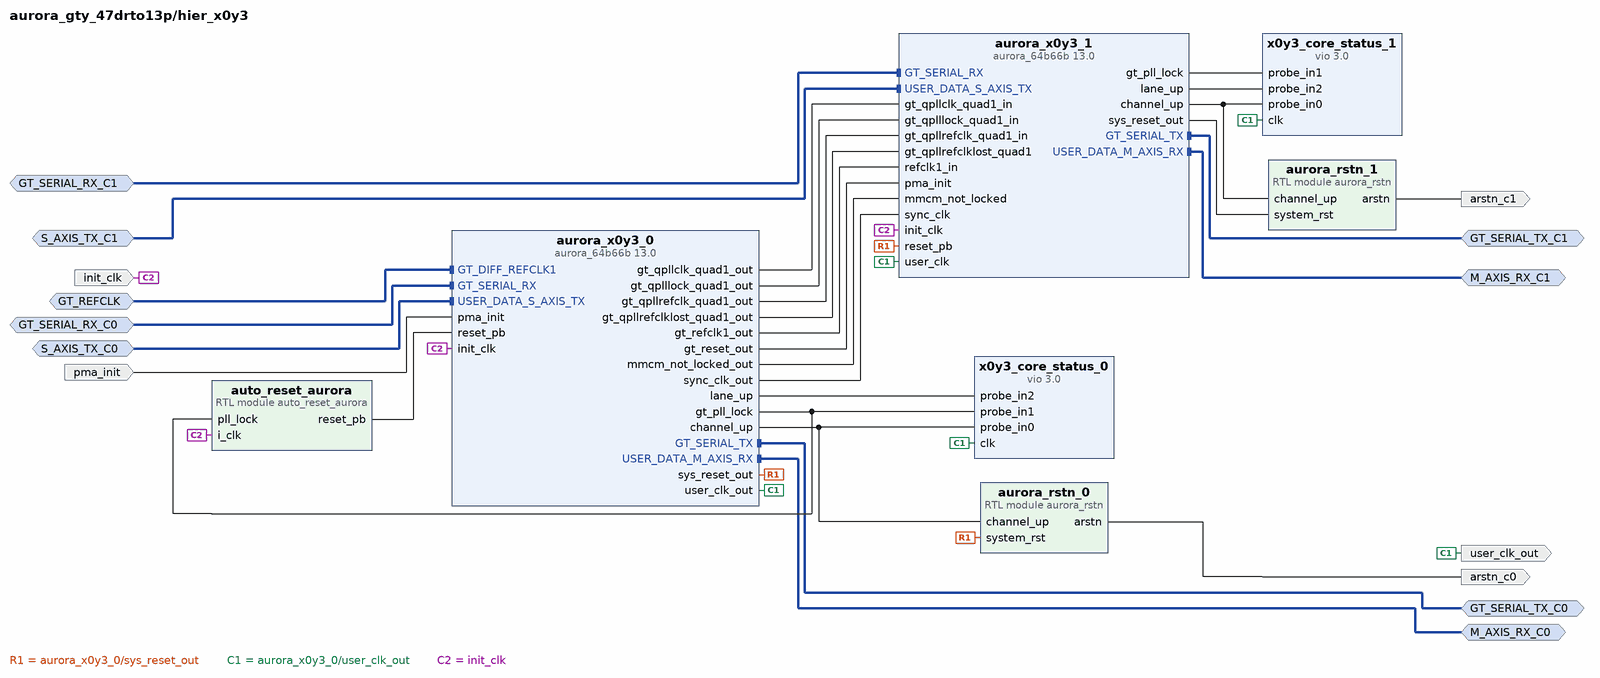
[diagram p15: block diagram inside /hier_x0y3]
create_bd_intf_pin -mode Slave -vlnv xilinx.com:interface:axis_rtl:1.0 S_AXIS_TX_C1
create_bd_intf_pin -mode Master -vlnv xilinx.com:interface:axis_rtl:1.0 M_AXIS_RX_C0
create_bd_intf_pin -mode Slave -vlnv xilinx.com:interface:axis_rtl:1.0 S_AXIS_TX_C0
create_bd_intf_pin -mode Master -vlnv xilinx.com:interface:axis_rtl:1.0 M_AXIS_RX_C1
create_bd_intf_pin -mode Slave -vlnv xilinx.com:interface:diff_clock_rtl:1.0 GT_REFCLK
create_bd_intf_pin -mode Slave -vlnv xilinx.com:display_aurora64b66b:GT_Serial_Transceiver_Pins_RX_rtl:1.0 GT_SERIAL_RX_C0
create_bd_intf_pin -mode Slave -vlnv xilinx.com:display_aurora64b66b:GT_Serial_Transceiver_Pins_RX_rtl:1.0 GT_SERIAL_RX_C1
create_bd_intf_pin -mode Master -vlnv xilinx.com:display_aurora64b66b:GT_Serial_Transceiver_Pins_TX_rtl:1.0 GT_SERIAL_TX_C1
create_bd_intf_pin -mode Master -vlnv xilinx.com:display_aurora64b66b:GT_Serial_Transceiver_Pins_TX_rtl:1.0 GT_SERIAL_TX_C0
create_bd_pin -dir O -type clk user_clk_out
create_bd_pin -dir I -type clk init_clk
create_bd_pin -dir I -type rst pma_init
create_bd_pin -dir O arstn_c0
create_bd_pin -dir O arstn_c1

create_bd_cell -type ip -vlnv xilinx.com:ip:vio:3.0 x0y3_core_status_0
set_property -dict [list \
  CONFIG.C_NUM_PROBE_IN 3 \
  CONFIG.C_NUM_PROBE_OUT 0 \
  CONFIG.C_PROBE_IN2_WIDTH 2 \
  CONFIG.C_PROBE_IN5_WIDTH 2 \
] [get_bd_cells x0y3_core_status_0]
create_bd_cell -type ip -vlnv xilinx.com:ip:vio:3.0 x0y3_core_status_1
set_property -dict {CONFIG.C_NUM_PROBE_IN 3 CONFIG.C_NUM_PROBE_OUT 0 CONFIG.C_PROBE_IN2_WIDTH 2} [get_bd_cells x0y3_core_status_1]
create_bd_cell -type module -reference auto_reset_aurora auto_reset_aurora
create_bd_cell -type ip -vlnv xilinx.com:ip:aurora_64b66b:13.0 aurora_x0y3_0
set_property -dict [list \
  CONFIG.CHANNEL_ENABLE {X0Y12 X0Y13} \
  CONFIG.C_AURORA_LANES 2 \
  CONFIG.C_LINE_RATE 25.625 \
  CONFIG.C_REFCLK_SOURCE MGTREFCLK0_of_Quad_X0Y3 \
  CONFIG.C_START_LANE X0Y12 \
  CONFIG.C_START_QUAD Quad_X0Y3 \
  CONFIG.SupportLevel 1 \
  CONFIG.drp_mode Disabled \
] [get_bd_cells aurora_x0y3_0]
create_bd_cell -type ip -vlnv xilinx.com:ip:aurora_64b66b:13.0 aurora_x0y3_1
set_property -dict [list \
  CONFIG.CHANNEL_ENABLE {X0Y14 X0Y15} \
  CONFIG.C_AURORA_LANES 2 \
  CONFIG.C_LINE_RATE 25.625 \
  CONFIG.C_REFCLK_SOURCE MGTREFCLK0_of_Quad_X0Y3 \
  CONFIG.C_START_LANE X0Y14 \
  CONFIG.C_START_QUAD Quad_X0Y3 \
  CONFIG.drp_mode Disabled \
] [get_bd_cells aurora_x0y3_1]
create_bd_cell -type module -reference aurora_rstn aurora_rstn_0
create_bd_cell -type module -reference aurora_rstn aurora_rstn_1

# ---- hierarchy /hier_rx_x0y3 ----
current_bd_instance /hier_rx_x0y3
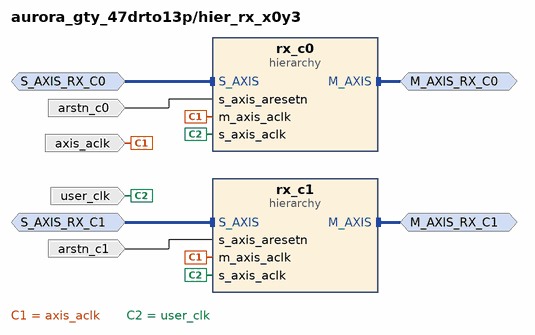
[diagram p16: block diagram inside /hier_rx_x0y3]
create_bd_intf_pin -mode Slave -vlnv xilinx.com:interface:axis_rtl:1.0 S_AXIS_RX_C0
create_bd_intf_pin -mode Slave -vlnv xilinx.com:interface:axis_rtl:1.0 S_AXIS_RX_C1
create_bd_intf_pin -mode Master -vlnv xilinx.com:interface:axis_rtl:1.0 M_AXIS_RX_C0
create_bd_intf_pin -mode Master -vlnv xilinx.com:interface:axis_rtl:1.0 M_AXIS_RX_C1
create_bd_pin -dir I -type clk user_clk
create_bd_pin -dir I -type clk axis_aclk
create_bd_pin -dir I -type rst arstn_c0
create_bd_pin -dir I -type rst arstn_c1

create_bd_cell -type hier rx_c0
create_bd_cell -type hier rx_c1

# ---- hierarchy /hier_rx_x0y3/rx_c0 ----
current_bd_instance /hier_rx_x0y3/rx_c0
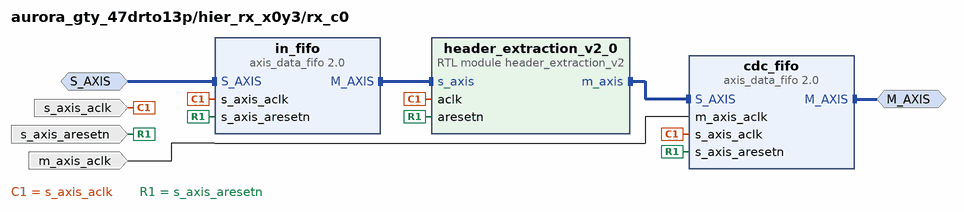
[diagram p17: block diagram inside /hier_rx_x0y3/rx_c0]
create_bd_intf_pin -mode Slave -vlnv xilinx.com:interface:axis_rtl:1.0 S_AXIS
create_bd_intf_pin -mode Master -vlnv xilinx.com:interface:axis_rtl:1.0 M_AXIS
create_bd_pin -dir I -type rst s_axis_aresetn
create_bd_pin -dir I -type clk s_axis_aclk
create_bd_pin -dir I -type clk m_axis_aclk

create_bd_cell -type ip -vlnv xilinx.com:ip:axis_data_fifo:2.0 in_fifo
create_bd_cell -type ip -vlnv xilinx.com:ip:axis_data_fifo:2.0 cdc_fifo
set_property -dict [list \
  CONFIG.FIFO_DEPTH 512 \
  CONFIG.HAS_TLAST 1 \
  CONFIG.IS_ACLK_ASYNC 1 \
  CONFIG.TDATA_NUM_BYTES 20 \
  CONFIG.TUSER_WIDTH 64 \
] [get_bd_cells cdc_fifo]
create_bd_cell -type module -reference header_extraction_v2 header_extraction_v2_0

# ---- hierarchy /hier_rx_x0y3/rx_c1 ----
current_bd_instance /hier_rx_x0y3/rx_c1
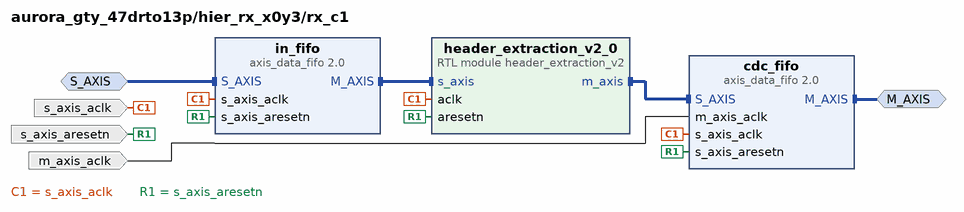
[diagram p18: block diagram inside /hier_rx_x0y3/rx_c1]
create_bd_intf_pin -mode Slave -vlnv xilinx.com:interface:axis_rtl:1.0 S_AXIS
create_bd_intf_pin -mode Master -vlnv xilinx.com:interface:axis_rtl:1.0 M_AXIS
create_bd_pin -dir I -type rst s_axis_aresetn
create_bd_pin -dir I -type clk s_axis_aclk
create_bd_pin -dir I -type clk m_axis_aclk

create_bd_cell -type ip -vlnv xilinx.com:ip:axis_data_fifo:2.0 in_fifo
create_bd_cell -type ip -vlnv xilinx.com:ip:axis_data_fifo:2.0 cdc_fifo
set_property -dict [list \
  CONFIG.FIFO_DEPTH 512 \
  CONFIG.HAS_TLAST 1 \
  CONFIG.IS_ACLK_ASYNC 1 \
  CONFIG.TDATA_NUM_BYTES 20 \
  CONFIG.TUSER_WIDTH 64 \
] [get_bd_cells cdc_fifo]
create_bd_cell -type module -reference header_extraction_v2 header_extraction_v2_0

# ---- hierarchy /hier_x0y4 ----
current_bd_instance /hier_x0y4
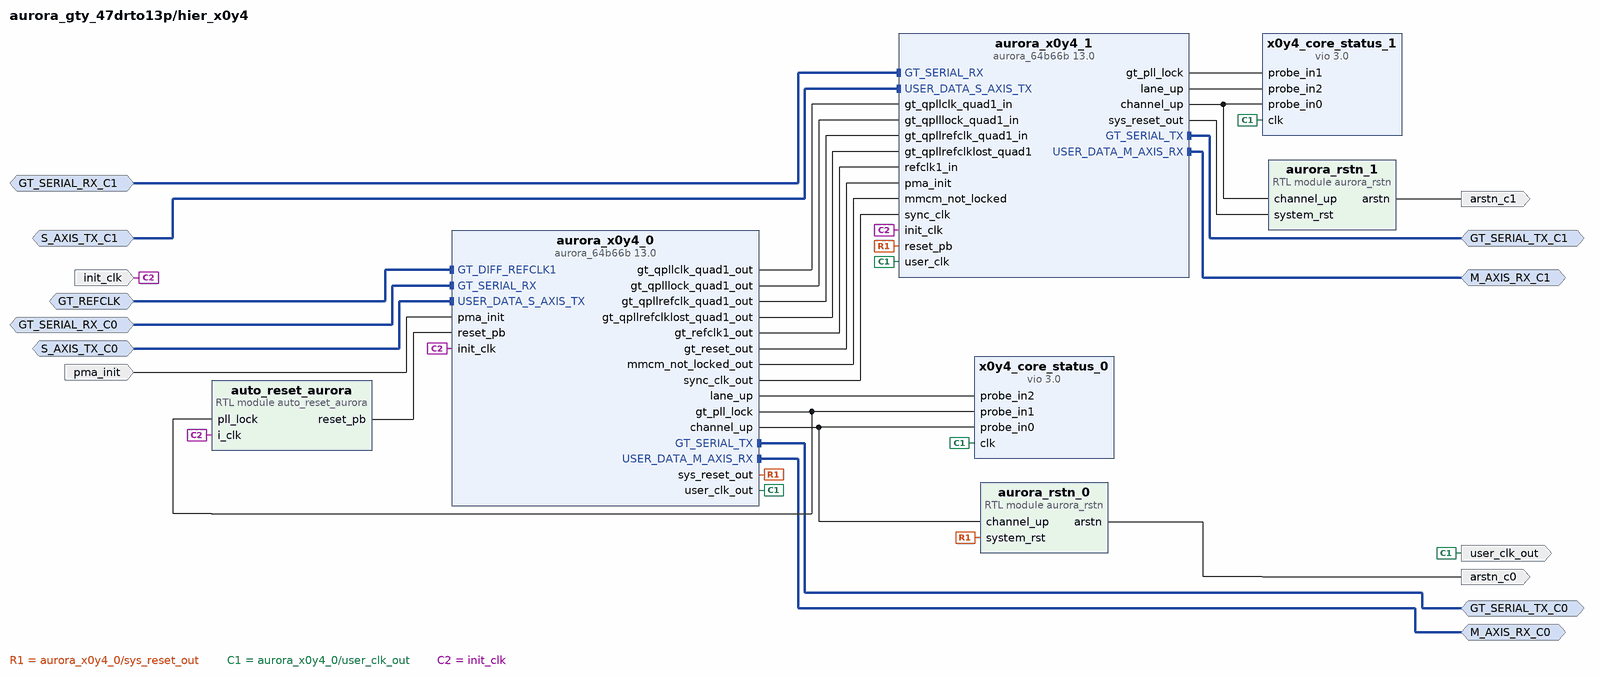
[diagram p19: block diagram inside /hier_x0y4]
create_bd_intf_pin -mode Slave -vlnv xilinx.com:interface:axis_rtl:1.0 S_AXIS_TX_C1
create_bd_intf_pin -mode Master -vlnv xilinx.com:interface:axis_rtl:1.0 M_AXIS_RX_C0
create_bd_intf_pin -mode Slave -vlnv xilinx.com:interface:axis_rtl:1.0 S_AXIS_TX_C0
create_bd_intf_pin -mode Master -vlnv xilinx.com:interface:axis_rtl:1.0 M_AXIS_RX_C1
create_bd_intf_pin -mode Slave -vlnv xilinx.com:interface:diff_clock_rtl:1.0 GT_REFCLK
create_bd_intf_pin -mode Slave -vlnv xilinx.com:display_aurora64b66b:GT_Serial_Transceiver_Pins_RX_rtl:1.0 GT_SERIAL_RX_C0
create_bd_intf_pin -mode Slave -vlnv xilinx.com:display_aurora64b66b:GT_Serial_Transceiver_Pins_RX_rtl:1.0 GT_SERIAL_RX_C1
create_bd_intf_pin -mode Master -vlnv xilinx.com:display_aurora64b66b:GT_Serial_Transceiver_Pins_TX_rtl:1.0 GT_SERIAL_TX_C1
create_bd_intf_pin -mode Master -vlnv xilinx.com:display_aurora64b66b:GT_Serial_Transceiver_Pins_TX_rtl:1.0 GT_SERIAL_TX_C0
create_bd_pin -dir O -type clk user_clk_out
create_bd_pin -dir I -type clk init_clk
create_bd_pin -dir I -type rst pma_init
create_bd_pin -dir O arstn_c0
create_bd_pin -dir O arstn_c1

create_bd_cell -type ip -vlnv xilinx.com:ip:vio:3.0 x0y4_core_status_0
set_property -dict [list \
  CONFIG.C_NUM_PROBE_IN 3 \
  CONFIG.C_NUM_PROBE_OUT 0 \
  CONFIG.C_PROBE_IN2_WIDTH 2 \
  CONFIG.C_PROBE_IN5_WIDTH 2 \
] [get_bd_cells x0y4_core_status_0]
create_bd_cell -type ip -vlnv xilinx.com:ip:vio:3.0 x0y4_core_status_1
set_property -dict {CONFIG.C_NUM_PROBE_IN 3 CONFIG.C_NUM_PROBE_OUT 0 CONFIG.C_PROBE_IN2_WIDTH 2} [get_bd_cells x0y4_core_status_1]
create_bd_cell -type module -reference auto_reset_aurora auto_reset_aurora
create_bd_cell -type ip -vlnv xilinx.com:ip:aurora_64b66b:13.0 aurora_x0y4_0
set_property -dict [list \
  CONFIG.CHANNEL_ENABLE {X0Y16 X0Y17} \
  CONFIG.C_AURORA_LANES 2 \
  CONFIG.C_LINE_RATE 25.625 \
  CONFIG.C_REFCLK_SOURCE MGTREFCLK0_of_Quad_X0Y4 \
  CONFIG.C_START_LANE X0Y16 \
  CONFIG.C_START_QUAD Quad_X0Y4 \
  CONFIG.SupportLevel 1 \
  CONFIG.drp_mode Disabled \
] [get_bd_cells aurora_x0y4_0]
create_bd_cell -type ip -vlnv xilinx.com:ip:aurora_64b66b:13.0 aurora_x0y4_1
set_property -dict [list \
  CONFIG.CHANNEL_ENABLE {X0Y18 X0Y19} \
  CONFIG.C_AURORA_LANES 2 \
  CONFIG.C_LINE_RATE 25.625 \
  CONFIG.C_REFCLK_SOURCE MGTREFCLK0_of_Quad_X0Y4 \
  CONFIG.C_START_LANE X0Y18 \
  CONFIG.C_START_QUAD Quad_X0Y4 \
  CONFIG.drp_mode Disabled \
] [get_bd_cells aurora_x0y4_1]
create_bd_cell -type module -reference aurora_rstn aurora_rstn_0
create_bd_cell -type module -reference aurora_rstn aurora_rstn_1

# ---- hierarchy /hier_rx_x0y4 ----
current_bd_instance /hier_rx_x0y4
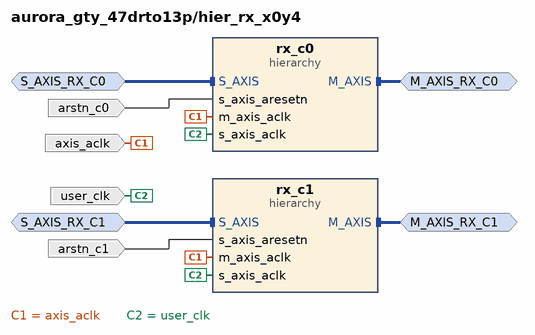
[diagram p20: block diagram inside /hier_rx_x0y4]
create_bd_intf_pin -mode Slave -vlnv xilinx.com:interface:axis_rtl:1.0 S_AXIS_RX_C0
create_bd_intf_pin -mode Slave -vlnv xilinx.com:interface:axis_rtl:1.0 S_AXIS_RX_C1
create_bd_intf_pin -mode Master -vlnv xilinx.com:interface:axis_rtl:1.0 M_AXIS_RX_C0
create_bd_intf_pin -mode Master -vlnv xilinx.com:interface:axis_rtl:1.0 M_AXIS_RX_C1
create_bd_pin -dir I -type clk user_clk
create_bd_pin -dir I -type clk axis_aclk
create_bd_pin -dir I -type rst arstn_c0
create_bd_pin -dir I -type rst arstn_c1

create_bd_cell -type hier rx_c0
create_bd_cell -type hier rx_c1

# ---- hierarchy /hier_rx_x0y4/rx_c0 ----
current_bd_instance /hier_rx_x0y4/rx_c0
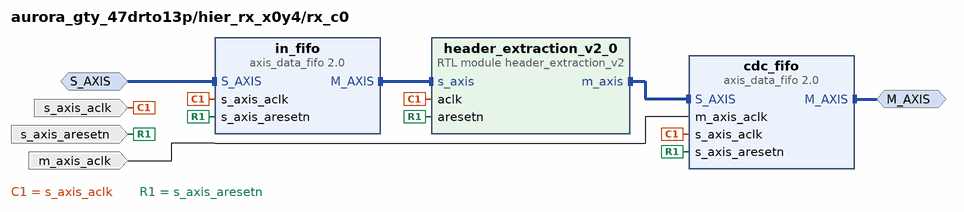
[diagram p21: block diagram inside /hier_rx_x0y4/rx_c0]
create_bd_intf_pin -mode Slave -vlnv xilinx.com:interface:axis_rtl:1.0 S_AXIS
create_bd_intf_pin -mode Master -vlnv xilinx.com:interface:axis_rtl:1.0 M_AXIS
create_bd_pin -dir I -type rst s_axis_aresetn
create_bd_pin -dir I -type clk s_axis_aclk
create_bd_pin -dir I -type clk m_axis_aclk

create_bd_cell -type ip -vlnv xilinx.com:ip:axis_data_fifo:2.0 in_fifo
create_bd_cell -type ip -vlnv xilinx.com:ip:axis_data_fifo:2.0 cdc_fifo
set_property -dict [list \
  CONFIG.FIFO_DEPTH 512 \
  CONFIG.HAS_TLAST 1 \
  CONFIG.IS_ACLK_ASYNC 1 \
  CONFIG.TDATA_NUM_BYTES 20 \
  CONFIG.TUSER_WIDTH 64 \
] [get_bd_cells cdc_fifo]
create_bd_cell -type module -reference header_extraction_v2 header_extraction_v2_0

# ---- hierarchy /hier_rx_x0y4/rx_c1 ----
current_bd_instance /hier_rx_x0y4/rx_c1
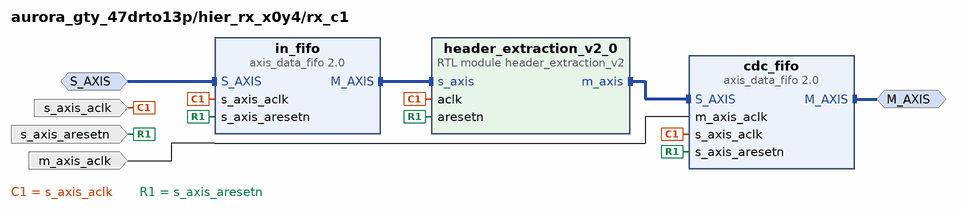
[diagram p22: block diagram inside /hier_rx_x0y4/rx_c1]
create_bd_intf_pin -mode Slave -vlnv xilinx.com:interface:axis_rtl:1.0 S_AXIS
create_bd_intf_pin -mode Master -vlnv xilinx.com:interface:axis_rtl:1.0 M_AXIS
create_bd_pin -dir I -type rst s_axis_aresetn
create_bd_pin -dir I -type clk s_axis_aclk
create_bd_pin -dir I -type clk m_axis_aclk

create_bd_cell -type ip -vlnv xilinx.com:ip:axis_data_fifo:2.0 in_fifo
create_bd_cell -type ip -vlnv xilinx.com:ip:axis_data_fifo:2.0 cdc_fifo
set_property -dict [list \
  CONFIG.FIFO_DEPTH 512 \
  CONFIG.HAS_TLAST 1 \
  CONFIG.IS_ACLK_ASYNC 1 \
  CONFIG.TDATA_NUM_BYTES 20 \
  CONFIG.TUSER_WIDTH 64 \
] [get_bd_cells cdc_fifo]
create_bd_cell -type module -reference header_extraction_v2 header_extraction_v2_0

# ---- hierarchy /hier_tx_x0y3 ----
current_bd_instance /hier_tx_x0y3
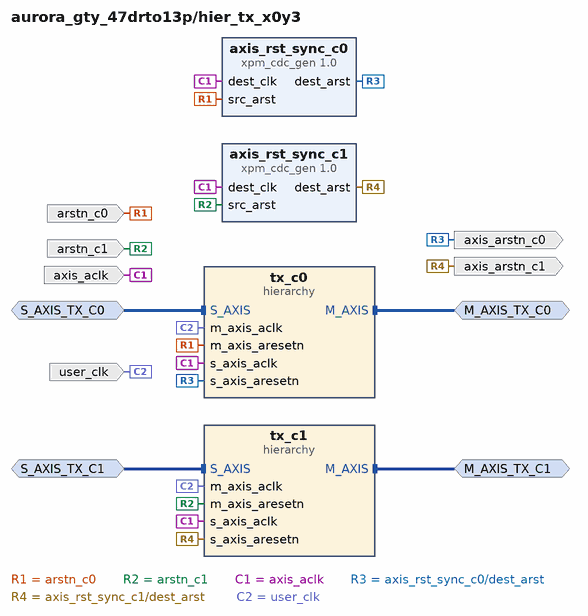
[diagram p23: block diagram inside /hier_tx_x0y3]
create_bd_intf_pin -mode Master -vlnv xilinx.com:interface:axis_rtl:1.0 M_AXIS_TX_C0
create_bd_intf_pin -mode Master -vlnv xilinx.com:interface:axis_rtl:1.0 M_AXIS_TX_C1
create_bd_intf_pin -mode Slave -vlnv xilinx.com:interface:axis_rtl:1.0 S_AXIS_TX_C1
create_bd_intf_pin -mode Slave -vlnv xilinx.com:interface:axis_rtl:1.0 S_AXIS_TX_C0
create_bd_pin -dir I -type clk user_clk
create_bd_pin -dir I -type clk axis_aclk
create_bd_pin -dir O -type rst axis_arstn_c0
create_bd_pin -dir O -type rst axis_arstn_c1
create_bd_pin -dir I -type rst arstn_c1
create_bd_pin -dir I -type rst arstn_c0

create_bd_cell -type ip -vlnv xilinx.com:ip:xpm_cdc_gen:1.0 axis_rst_sync_c0
set_property -dict {CONFIG.CDC_TYPE xpm_cdc_async_rst} [get_bd_cells axis_rst_sync_c0]
create_bd_cell -type ip -vlnv xilinx.com:ip:xpm_cdc_gen:1.0 axis_rst_sync_c1
set_property -dict {CONFIG.CDC_TYPE xpm_cdc_async_rst} [get_bd_cells axis_rst_sync_c1]
create_bd_cell -type hier tx_c0
create_bd_cell -type hier tx_c1

# ---- hierarchy /hier_tx_x0y3/tx_c0 ----
current_bd_instance /hier_tx_x0y3/tx_c0
